# Altium schematic sheet SD-Card-Sheet.SchDoc
size 420 x 297 mm
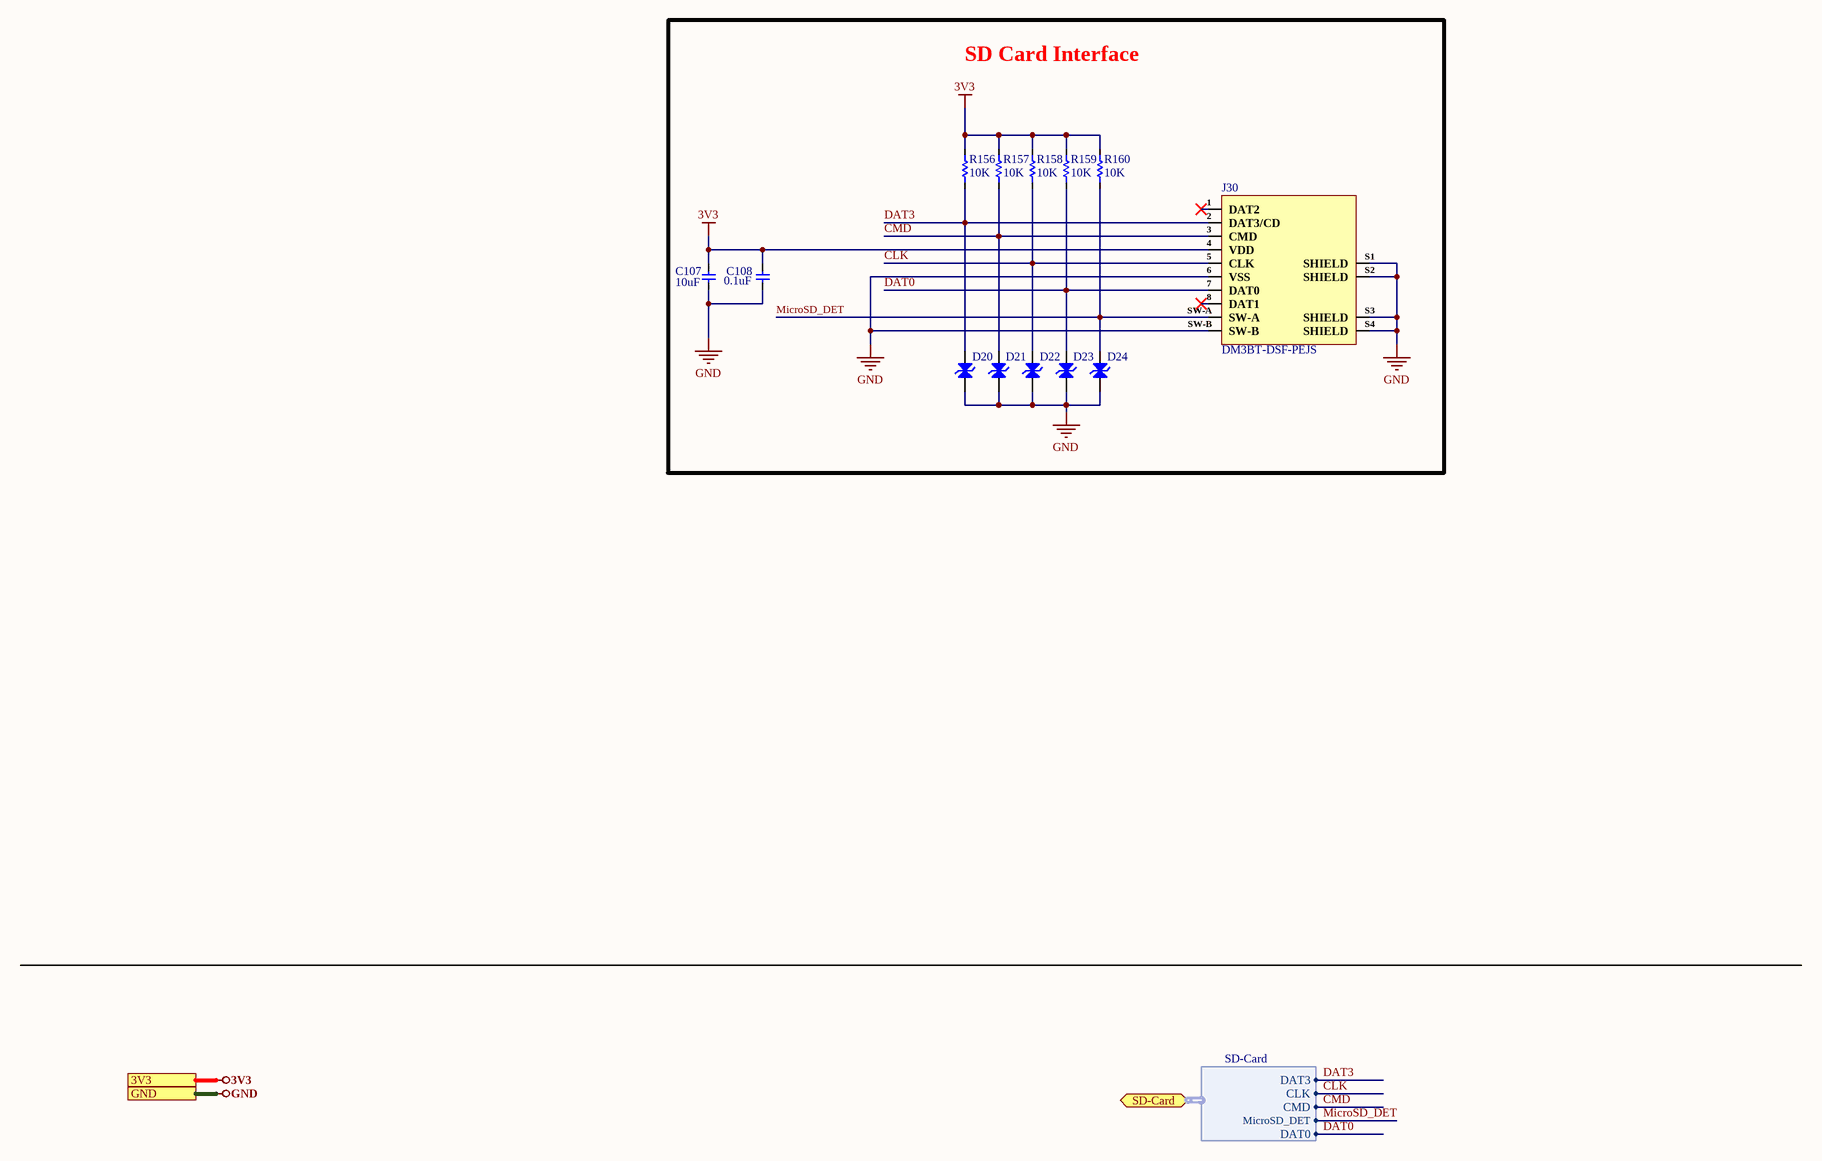
[diagram p0: SD-Card-Sheet.SchDoc]

## Parts
C107  10uF  [Cap-0402]
C108  0.1uF  [CAP-0201]
D20  LESD8D3.3CAT5G  [SOD-882 Bi Directional]  (value not drawn)
D21  LESD8D3.3CAT5G  [SOD-882 Bi Directional]  (value not drawn)
D22  LESD8D3.3CAT5G  [SOD-882 Bi Directional]  (value not drawn)
D23  LESD8D3.3CAT5G  [SOD-882 Bi Directional]  (value not drawn)
D24  LESD8D3.3CAT5G  [SOD-882 Bi Directional]  (value not drawn)
J30  DM3BT-DSF-PEJS  [DM3BT-DSF-PEJS]
R156  10K  [Res-0201]
R157  10K  [Res-0201]
R158  10K  [Res-0201]
R159  10K  [Res-0201]
R160  10K  [Res-0201]

## Blocks framed on the sheet
SD Card Interface: C107 C108 D20-D24 J30 R156-R160

## Ports
3V3, GND, SD-Card (bidir, harness SD-Card)

## Harnesses
SD-Card: DAT3, CLK, CMD, DAT0, MicroSD_DET

## Nets
3V3: C107.2 C108.2 J30.4(VDD) R156.2 R157.2 R158.2 R159.2 R160.2 ; port 3V3
GND: C107.1 C108.1 D20.1(A) D21.1(A) D22.1(A) D23.1(A) D24.1(A) J30.6(VSS) J30.S1(SHIELD) J30.S2(SHIELD) J30.S3(SHIELD) J30.S4(SHIELD) J30.SW-B ; port GND
CLK: D22.2(A) J30.5(CLK) R158.1 ; port SD-Card.CLK
CMD: D21.2(A) J30.3(CMD) R157.1 ; port SD-Card.CMD
DAT0: D23.2(A) J30.7(DAT0) R159.1 ; port SD-Card.DAT0
DAT3: D20.2(A) J30.2(DAT3/CD) R156.1 ; port SD-Card.DAT3
MicroSD_DET: D24.2(A) J30.SW-A R160.1 ; port SD-Card.MicroSD_DET

Not connected (* = marked no-connect by the designer): J30 1(DAT2)* 8(DAT1)*

## Notes on the sheet
- File:
- Title:
- Date:
- Page
- Num:
- Total:
- Drawn By: Huzaifa Ali

## Library data of the parts
C107 = CC0402MRX5R6BB106: CAP CER 10UF 10V X5R 0402; Manufacturer: Yageo; Tolerance: 20%; Item Type: Capacitor; Supplier 1: Future Electronics; Manufacturer Part Number: CC0402MRX5R6BB106; RoHS: Yes; Category: Ceramic Capacitors; Stock 1: 80000; Pricing 1: 10000=0.02650, 20000=0.02590, 30000=0.02550, 40000=0.02530, 50000=0.02450 (USD); Mount: Surface Mount; Case/Package: 0402; Case Code (Imperial): 0402; Case Code (Metric): 1005; Min Operating Temperature: -55°C; Max Operating Temperature: 85°C; Packaging: Tape and Reel; Capacitance: 10uF; Voltage Rating: 10V; RoHS Compliant: Yes; ComponentLink1URL: http://www.yageo.com/documents/recent/UPY-GPHC_X5R_4V-to-50V_25.pdf?src-supplier=Digi-Key; ComponentLink1Description: http://www.yageo.com/documents/recent/UPY-GPHC_X5R_4V-to-50V_25.pdf?src-supplier=Digi-Key; Supplier Part Number 1: 6097631; LCSC Part Number: C962143
C108 = GRM033C81E104KE14D: CAP CER 0.1UF 25V X6S 0201; Manufacturer: Murata; Capacitance: 100nF; Tolerance: 10%; Supplier 1: Digi-Key; Manufacturer Part Number: GRM033C81E104KE14D; RoHS: Yes; Category: Ceramic Capacitors; Stock 1: 91; Pricing 1: 1=0.10000, 10=0.05100, 50=0.02780, 100=0.02260, 500=0.01616, 1000=0.01270, 2500=0.01155, 5000=0.01063 (USD); Mount: Surface Mount; Case/Package: 0201; Case Code (Metric): 0603; Case Code (Imperial): 0201; Min Operating Temperature: -55°C; Max Operating Temperature: 105°C; Dielectric: X6S; Packaging: Tape and Reel; Voltage Rating: 25V; Package Quantity: 15000; Voltage Rating (DC): 25V; Termination: SMD/SMT; Length: 0.024inch; Width: 0.3mm; Height: 0.3mm; Thickness: 0.013inch; RoHS Compliant: Yes; ComponentLink1URL: http://www.mouser.com/ds/2/281/c02e-2905.pdf?src-supplier=Mouser; ComponentLink1Description: http://www.mouser.com/ds/2/281/c02e-2905.pdf?src-supplier=Mouser; ComponentLink2URL: http://www.farnell.com/datasheets/2722733.pdf?src-supplier=Farnell; ComponentLink2Description: http://www.farnell.com/datasheets/2722733.pdf?src-supplier=Farnell; ComponentLink3URL: http://search.murata.co.jp/Ceramy/image/img/A01X/G101/ENG/GRM033C81E104KE14-01.pdf?src-supplier=Digi-Key; ComponentLink3Description: http://search.murata.co.jp/Ceramy/image/img/A01X/G101/ENG/GRM033C81E104KE14-01.pdf?src-supplier=Digi-Key; Supplier Part Number 1: 490-10403-1-ND; Weight: 1.2E-05oz
D20-D24 = LESD8D3.3CAT5G: 5V 10V 3.3V Bi-Directional SOD-882 ESD Protection Devices ROHS; Manufacturer: LRC; Manufacturer Part Number: LESD8D3.3CAT5G; Package: SOD-882; LCSC Part Number: C172409; Item Type: Protection Device; ComponentLink1Description: LCSC; ComponentLink1URL: https://www.lcsc.com/product-detail/span-style-background-color-ff0-ESD-span-Protection-Devices_LRC-LESD8D3-3CAT5G_C172409.html
J30 = DM3BT-DSF-PEJS: CONN MICRO SD CARD PUSH-PUSH R/A; Manufacturer: Hirose; Max Current Rating: 500mA; Contact Resistance: 100mR; Voltage Rating (AC): 125V; Gender: Female; Number of Contacts: 8; Connector Type: Connector,Socket; Insulation Resistance: 1GR; Pitch: 1.1mm; Item Type: SD Card Connector; Supplier 1: Future Electronics; Manufacturer Part Number: DM3BT-DSF-PEJS; RoHS: Yes; Category: Memory Connectors; Stock 1: 9600; Pricing 1: 1200=1.39000 (USD); Mount: Surface Mount,Reverse; Contact Material: Copper Alloy,Copper; Contact Plating: Gold; Housing Material: Polymer; Min Operating Temperature: -25°C; Max Operating Temperature: 85°C; Number of Rows: 1; Packaging: Tape and Reel; Current Rating: 500mA; Package Quantity: 1; Termination: Solder; Max Voltage Rating (AC): 125V; Number of Positions: 8; Orientation: Right Angle; Series: DM3; Length: 13.85mm; Width: 16.05mm; Depth: 1.83mm; Radiation Hardening: No; Reach SVHC Compliant: Yes; Lead Free: Lead Free; Flammability Rating: UL94 V-0; RoHS Compliant: Yes; ComponentLink1URL: https://datasheet.ciiva.com/683/doc-1806131255093-683387.pdf?src-supplier=Digi-Key; ComponentLink1Description: https://datasheet.ciiva.com/683/doc-1806131255093-683387.pdf?src-supplier=Digi-Key; Supplier Part Number 1: 3000978; LCSC Part Number: C597972
R156-R160 = RC0201FR-0710KL: RES SMD 10K OHM 1% 1/20W 0201; Manufacturer: Yageo; Item Type: Resistor; Manufacturer Part Number: RC0201FR-0710KL; ComponentLink7URL: https://www.lcsc.com/product-detail/Chip-Resistor-Surface-Mount_YAGEO-RC0201FR-0710KL_C106225.html; ComponentLink7Description: LCSC; LCSC Part Number: C106225; Package: 0201